# Altium schematic sheet Power_Sheet.SchDoc
size A4; SheetNumber: 4; SheetTotal: 4
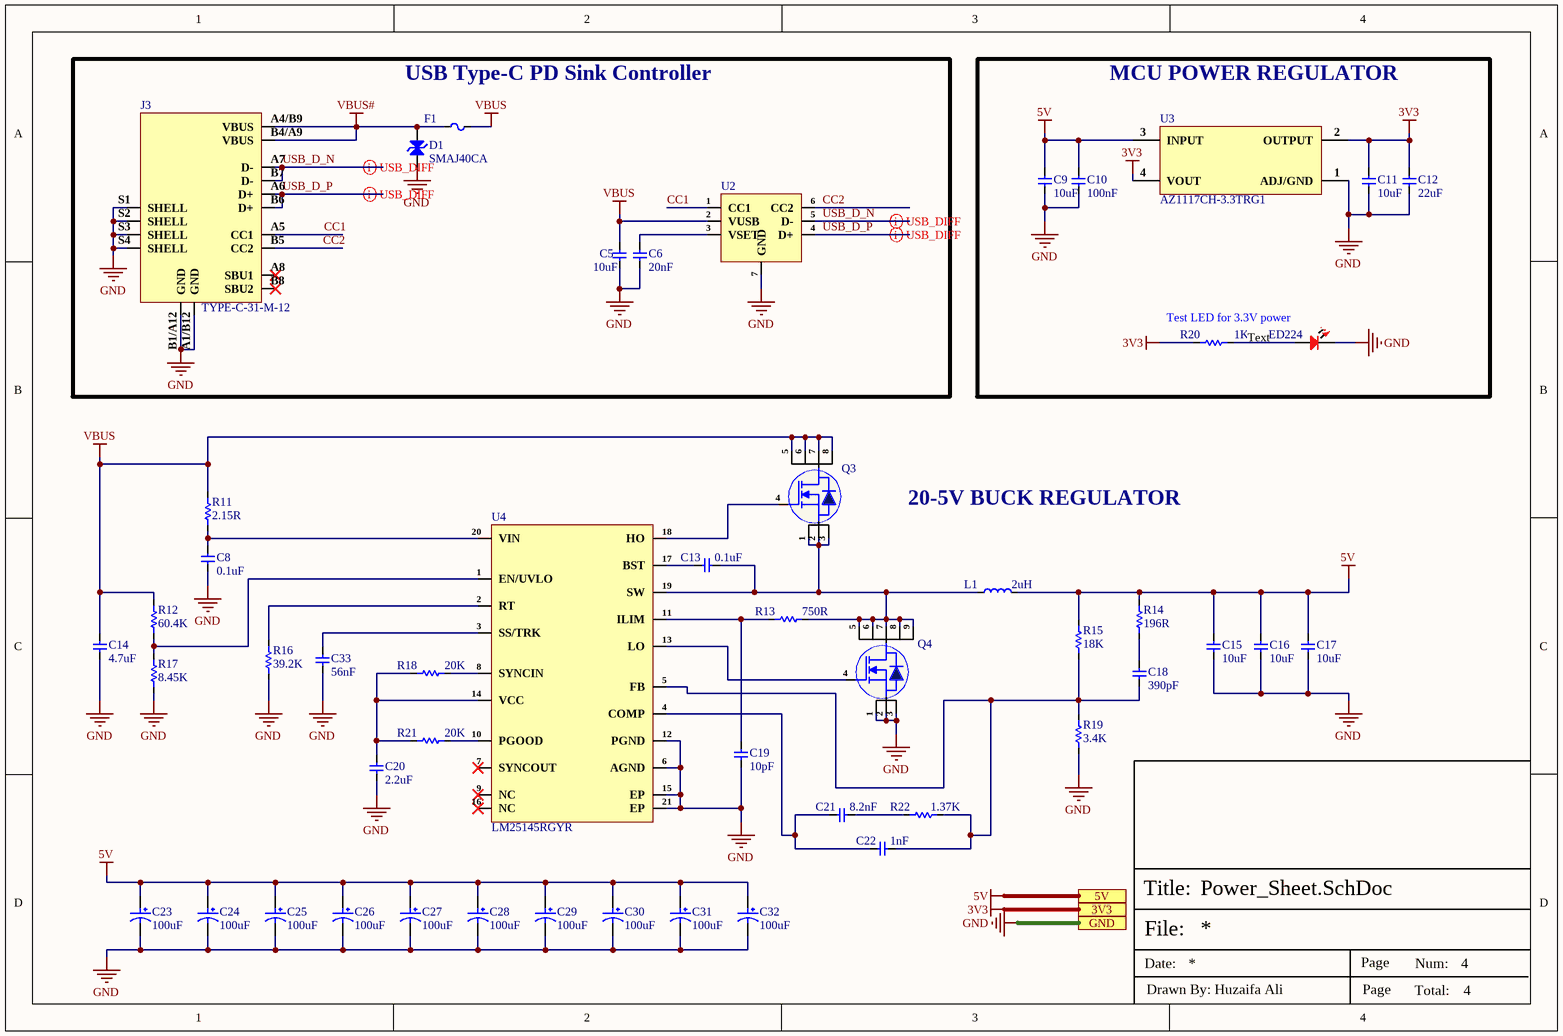
[diagram p0: Power_Sheet.SchDoc]

## Parts
C5  10uF  [Cap-0603]
C6  20nF  [Cap-0603]
C8  0.1uF  [Cap-0603]
C9  10uF  [Cap-0603]
C10  100nF  [Cap-0402]
C11  10uF  [Cap-0603]
C12  22uF  [Cap-0805]
C13  0.1uF  [Cap-0603]
C14  4.7uF  [Cap-0402]
C15  10uF  [Cap-0603]
C16  10uF  [Cap-0603]
C17  10uF  [Cap-0603]
C18  390pF  [Cap-0402]
C19  10pF  [Cap-0603]
C20  2.2uF  [Cap-0402]
C21  8.2nF  [Cap-0402]
C22  1nF  [Cap-0402]
C23  100uF  [EFVM025ADA101M0645]
C24  100uF  [EFVM025ADA101M0645]
C25  100uF  [EFVM025ADA101M0645]
C26  100uF  [EFVM025ADA101M0645]
C27  100uF  [EFVM025ADA101M0645]
C28  100uF  [EFVM025ADA101M0645]
C29  100uF  [EFVM025ADA101M0645]
C30  100uF  [EFVM025ADA101M0645]
C31  100uF  [EFVM025ADA101M0645]
C32  100uF  [EFVM025ADA101M0645]
C33  56nF  [Cap-0402]
D1  SMAJ40CA  [SMA Bi Directional]
F1  CF06V2T3R15  [Fuse-0603]  (value not drawn)
J3  TYPE-C-31-M-12  [TYPE-C-31-M-12_]
L1  2uH  [XAL1580-202MED]
LED224  RED  [LED-0603]  (value not drawn)
Q3  CSD17309Q3  [8-VSON-CLIP (3.3x3.3)]  (value not drawn)
Q4  CSD17573Q5B  [PDFN-8(5x6)]  (value not drawn)
R11  2.15R  [Res-0603]
R12  60.4K  [Res-0402]
R13  750R  [Res-0402]
R14  196R  [Res-0402]
R15  18K  [Res-0402]
R16  39.2K  [Res-0402]
R17  8.45K  [Res-0603]
R18  20K  [Res-0603]
R19  3.4K  [Res-0402]
R20  1K  [Res-0603]
R21  20K  [Res-0603]
R22  1.37K  [Res-0402]
U2  HUSB237-AA001-DN06R  [DFN-6L-EP(2x2)]  (value not drawn)
U3  AZ1117CH-3.3TRG1  [SOT- 223]
U4  LM25145RGYR  [20-VQFN (3.5x4.5)]

## Blocks framed on the sheet
USB Type-C PD Sink Controller: C5 C6 D1 F1 J3 U2
MCU POWER REGULATOR: C9-C12 LED224 R20 U3

## Ports
3V3 (see Top_Sheet[1A], Controller_Sheet[3D]), 5V (see Top_Sheet[1A], Controller_Sheet[3D], LED_Sheet[3D]), GND (see Top_Sheet[2B], Controller_Sheet[3D], LED_Sheet[3D])

## Nets
3V3: C11.2 C12.2 R20.1 U3.2(OUTPUT) U3.4(VOUT) ; port 3V3
5V: C9.2 C10.2 C15.2 C16.2 C17.2 C23.1 C24.1 C25.1 C26.1 C27.1 C28.1 C29.1 C30.1 C31.1 C32.1 L1.2 R14.2 R15.2 U3.3(INPUT) ; port 5V
GND: C5.1 C6.1 C8.1 C9.1 C10.1 C11.1 C12.1 C14.1 C15.1 C16.1 C17.1 C19.1 C20.1 C23.2 C24.2 C25.2 C26.2 C27.2 C28.2 C29.2 C30.2 C31.2 C32.2 C33.1 D1.1(A) J3.A1/B12(GND) J3.B1/A12(GND) J3.S1(SHELL) J3.S2(SHELL) J3.S3(SHELL) J3.S4(SHELL) LED224.2 Q4.1(S) Q4.2(S) Q4.3(S) R16.1 R17.1 R19.1 U2.7(GND) U3.1(ADJ/GND) U4.6(AGND) U4.12(PGND) U4.15(EP) U4.21(EP) ; port GND
VBUS: C5.2 C14.2 F1.2 Q3.5(D) Q3.6(D) Q3.7(D) Q3.8(D) R11.2 R12.2 U2.2(VUSB)
VBUS#: D1.2(K) F1.1 J3.A4/B9(VBUS) J3.B4/A9(VBUS)
CC1: J3.A5(CC1) U2.1(CC1)
CC2: J3.B5(CC2) U2.6(CC2)
USB_D_N: J3.A7(D-) J3.B7(D-) U2.5(D-)
USB_D_P: J3.A6(D+) J3.B6(D+) U2.4(D+)
NetC6_2: C6.2 U2.3(VSET)
NetC8_2: C8.2 R11.1 U4.20(VIN)
NetC13_1: C13.1 U4.17(BST)
NetC13_2: C13.2 L1.1 Q3.1(S) Q3.2(S) Q3.3(S) Q4.5(D) Q4.6(D) Q4.7(D) Q4.8(D) Q4.9(D) R13.2 U4.19(SW)
NetC18_1: C18.1 C22.2 R15.1 R19.2 R22.2 U4.5(FB)
NetC18_2: C18.2 R14.1
NetC19_2: C19.2 R13.1 U4.11(ILIM)
NetC20_2: C20.2 R18.1 R21.1 U4.14(VCC)
NetC21_1: C21.1 C22.1 U4.4(COMP)
NetC21_2: C21.2 R22.1
NetC33_2: C33.2 U4.3(SS/TRK)
NetLED224_1: LED224.1 R20.2
NetQ3_4: Q3.4(G) U4.18(HO)
NetQ4_4: Q4.4(G) U4.13(LO)
NetR12_1: R12.1 R17.2 U4.1(EN/UVLO)
NetR16_2: R16.2 U4.2(RT)
NetR18_2: R18.2 U4.8(SYNCIN)
NetR21_2: R21.2 U4.10(PGOOD)

Not connected (* = marked no-connect by the designer): J3 A8(SBU1)* B8(SBU2)*; U4 7(SYNCOUT)* 9(NC)* 16(NC)*

## Layout directives
differential pair; net class USB_DIFF; differential pair class USB_DIFF_Lines; rule Matched Net Lengths [Tolerance = 20mil]; rule Impedance Constraint [Min = 85.00    Max = 95.00    ]: USB_D_N, USB_D_P

## Notes on the sheet
- Test LED for 3.3V power
- (near R20) Text
- (near LED224) Text
- 20-5V BUCK REGULATOR
- File:
- Title:
- Date:
- Page
- Num:
- Total:
- Drawn By: Huzaifa Ali

## Library data of the parts
C5 C9 C11 = GRM188R61E106KA73D: CAP CER 10UF 25V X5R 0603; Manufacturer: Murata; Supplier 1: Mouser; Manufacturer Part Number: GRM188R61E106KA73D; RoHS: Yes; Category: Ceramic Capacitors; Stock 1: 319428; Pricing 1: 1=0.36000, 10=0.25800, 50=0.25800, 100=0.15500, 1000=0.09800, 10000=0.06900 (USD); Case/Package: 0603; RoHS Compliant: Yes; ComponentLink1URL: https://search.murata.co.jp/Ceramy/image/img/A01X/G101/ENG/GRM188R61E106KA73-01.pdf?src-supplier=Digi-Key; ComponentLink1Description: https://search.murata.co.jp/Ceramy/image/img/A01X/G101/ENG/GRM188R61E106KA73-01.pdf?src-supplier=Digi-Key; Supplier Part Number 1: 81-GRM188R61E106KA3D; LCSC Part Number: C344022
C6 = CGA0603X7R203K500JT: 50V 20nF X7R ±10% 0603 Multilayer Ceramic Capacitors MLCC - SMD/SMT ROHS; Manufacturer: HRE; LCSC Part Number: C36911410; Manufacturer Part Number: CGA0603X7R203K500JT; Value: 20nF; Item Type: Capacitor; ComponentLink1Description: LCSC; ComponentLink1URL: https://www.lcsc.com/product-detail/Multilayer-Ceramic-Capacitors-MLCC-SMD-SMT_HRE-CGA0603X7R203K500JT_C36911410.html
C8 C13 = CC0603JRX7R9BB104: CAP CER 0.1UF 50V X7R 0603; Manufacturer: Yageo; Item Type: Capacitors; Material: 4241ConductorMaterial; Supplier: Future Electronics; LCSC Part Number: C91183; Manufacturer Part Number: CC0603JRX7R9BB104; RoHS: Yes; Stock: 204000; Pricing: 4000=0.0077, 16000=0.0073, 60000=0.007, 160000=0.0068, 400000=0.0064 (USD); Pins: 2NUMBER; Lead Free: 5697LeadFree; Halogen Free: 5694HalogenFree; ComponentLink1URL: https://datasheet.ciiva.com/11465/upy-gphc-x7r-6-3v-to-50v-8-11465038.pdf?src-supplier=Avnet; ComponentLink1Description: https://datasheet.ciiva.com/11465/upy-gphc-x7r-6-3v-to-50v-8-11465038.pdf?src-supplier=Avnet
C10 = CC0402KRX5R7BB104: CAP CER 0.1UF 16V X5R 0402; Manufacturer: Yageo; Tolerance: 10%; Supplier 1: Mouser; Manufacturer Part Number: CC0402KRX5R7BB104; RoHS: Yes; Category: Ceramic Capacitors; Stock 1: 936792; Pricing 1: 1=0.10000, 10=0.02300, 50=0.02300, 100=0.01100, 1000=0.00600, 10000=0.00400 (USD); Mount: Surface Mount; Case/Package: 0402; Number of Pins: 2; Case Code (Metric): 1005; Case Code (Imperial): 0402; Min Operating Temperature: -55°C; Max Operating Temperature: 85°C; Capacitance: 100nF; Dielectric: X5R; Packaging: Tape and Reel; Voltage Rating: 16V; Package Quantity: 1; Voltage Rating (DC): 16V; Termination: SMD/SMT; Resistor Type: Ceramic; Series: CC; Construction: Flat; Length: 1mm; Width: 0.02inch; Height: 0.5mm; Thickness: 0.022inch; Depth: 0.5mm; Radiation Hardening: No; REACH SVHC: Unknown; Lead Free: Lead Free; Halogen Free: Halogen Free; RoHS Compliant: Yes; ComponentLink1URL: https://datasheet.ciiva.com/155/mlccorderingcode-155879.pdf?src-supplier=Digi-Key; ComponentLink1Description: https://datasheet.ciiva.com/155/mlccorderingcode-155879.pdf?src-supplier=Digi-Key; ComponentLink2URL: https://datasheet.ciiva.com/155/mlccorderingcode-155878.pdf?src-supplier=Digi-Key; ComponentLink2Description: https://datasheet.ciiva.com/155/mlccorderingcode-155878.pdf?src-supplier=Digi-Key; ComponentLink3URL: https://datasheet.ciiva.com/155/mlccorderingcode-155880.pdf?src-supplier=Digi-Key; ComponentLink3Description: https://datasheet.ciiva.com/155/mlccorderingcode-155880.pdf?src-supplier=Digi-Key; ComponentLink4URL: https://datasheet.ciiva.com/11464/upy-gphc-x5r-4v-to-50v-12-11464869.pdf?src-supplier=Avnet; ComponentLink4Description: https://datasheet.ciiva.com/11464/upy-gphc-x5r-4v-to-50v-12-11464869.pdf?src-supplier=Avnet; Supplier Part Number 1: 603-CC402KRX5R7BB104; LCSC Part Number: C106204
C12 = C2012X5R1V226MT000E: CAP CER 22UF 35V X5R 0805; Manufacturer: TDK Corporation; Item Type: Capacitor; Manufacturer Part Number: C2012X5R1V226MT000E; Package: 0805; ComponentLink1Description: LCSC; ComponentLink1URL: https://www.lcsc.com/product-detail/Multilayer-Ceramic-Capacitors-MLCC-SMD-SMT_TDK-C2012X5R1V226M125AC_C2179409.html; LCSC Part Number: C338080
C14 = CC1206KKX7R9BB475: CAP CER 4.7UF 50V X7R 1206; Manufacturer: Yageo; Item Type: Capacitors; Material: Ceramic; Tolerance: 10%; Supplier: Digikey; LCSC Part Number: C132170; Manufacturer Part Number: CC1206KKX7R9BB475; RoHS: Yes; Stock: 6022; Pricing: 1=0.42, 10=0.255, 100=0.1694, 1000=0.1248 (USD); Mounting Technology: Surface Mount; Case/Package: 1206; Case Code (Metric): 3216; Case Code (Imperial): 1206; Min Operating Temperature: -55°C; Max Operating Temperature: 125°C; Value: 4.7uF; Packaging: Cut Tape; Voltage Rating: 50V; Series: CC; Length: 0.126inch; Width: 0.063inch; Height: 1.45mm; Thickness: 0.071inch; Lead Free: Lead Free; Halogen Free: Halogen Free; RoHS Compliant: Yes; ComponentLink1URL: http://www.mouser.com/ds/2/447/Yageo_UPY-GP_NP0_16V-to-50V_9-358835.pdf?src-supplier=Mouser; ComponentLink1Description: http://www.mouser.com/ds/2/447/Yageo_UPY-GP_NP0_16V-to-50V_9-358835.pdf?src-supplier=Mouser; ComponentLink2URL: https://datasheet.octopart.com/CC1206KKX7R9BB475-Yageo-datasheet-147453679.pdf?src-supplier=Newark; ComponentLink2Description: https://datasheet.octopart.com/CC1206KKX7R9BB475-Yageo-datasheet-147453679.pdf?src-supplier=Newark; ComponentLink3URL: http://www.yageo.com/documents/recent/UPY-GPHC_X7R_6.3V-to-50V_18.pdf?src-supplier=Digikey; ComponentLink3Description: http://www.yageo.com/documents/recent/UPY-GPHC_X7R_6.3V-to-50V_18.pdf?src-supplier=Digikey; ComponentLink4URL: https://datasheet.octopart.com/CC1206KKX7R9BB475-Yageo-datasheet-166511530.pdf?src-supplier=Future+Electronics; ComponentLink4Description: https://datasheet.octopart.com/CC1206KKX7R9BB475-Yageo-datasheet-166511530.pdf?src-supplier=Future+Electronics
C15-C17 = GRM188Z71A106KA73D: CAP CER 10UF 10V X7R 0603; Manufacturer: Murata; Item Type: Capacitor; Material: 4241ConductorMaterial; Tolerance: 10%; Supplier: Mouser; LCSC Part Number: C2959727; Manufacturer Part Number: GRM188Z71A106KA73D; RoHS: Yes; Stock: 390983; Pricing: 1=0.36, 10=0.155, 50=0.155, 100=0.104, 1000=0.094, 10000=0.065 (USD); Case/Package: 345Case; Min Operating Temperature: -55°C; Max Operating Temperature: 125°C; Value: 10uF; Voltage Rating: 10V; Length: 1.6mm; Width: 800um; Height: 1mm; Thickness: 800um; RoHS Compliant: Yes; ComponentLink1URL: https://datasheet.octopart.com/GRM188Z71A106KA73D-Murata-datasheet-165579666.pdf?src-supplier=TME; ComponentLink1Description: https://datasheet.octopart.com/GRM188Z71A106KA73D-Murata-datasheet-165579666.pdf?src-supplier=TME
C18 = CC0402JRX7R9BB391: CAP CER 390PF 50V X7R 0402; Manufacturer: Yageo; Item Type: Capacitors; Tolerance: 5%; Supplier: Digikey; LCSC Part Number: C527008; Manufacturer Part Number: CC0402JRX7R9BB391; RoHS: Yes; Stock: 114168; Pricing: 1=0.1, 10=0.031, 100=0.0179, 1000=0.01116, 2500=0.0095, 5000=0.00851 (USD); Mounting Technology: Surface Mount; Case/Package: 0402; Case Code (Imperial): 0402; Case Code (Metric): 1005; Weight: 2.3E-05oz; Min Operating Temperature: -55°C; Max Operating Temperature: 125°C; Packaging: Tape and Reel; Value: 390pF; Voltage Rating (DC): 50V; Dielectric: X7R; Termination: SMD/SMT; Voltage Rating: 50V; Series: CC; Length: 0.039inch; Width: 0.02inch; Thickness: 0.022inch; Lead Free: Lead Free; Halogen Free: Halogen Free; RoHS Compliant: Yes; ComponentLink1URL: http://www.mouser.com/ds/2/447/Yageo_UPY-GP_NP0_16V-to-50V_9-358835.pdf?src-supplier=Mouser; ComponentLink1Description: http://www.mouser.com/ds/2/447/Yageo_UPY-GP_NP0_16V-to-50V_9-358835.pdf?src-supplier=Mouser; ComponentLink2URL: http://www.yageo.com/documents/recent/UPY-GPHC_X7R_6.3V-to-50V_18.pdf?src-supplier=Digikey; ComponentLink2Description: http://www.yageo.com/documents/recent/UPY-GPHC_X7R_6.3V-to-50V_18.pdf?src-supplier=Digikey; ComponentLink3URL: http://www.yageo.com/exep/pages/download/literatures/ProductSelectionGuide%202014_Final_2.pdf?src-supplier=Digikey; ComponentLink3Description: http://www.yageo.com/exep/pages/download/literatures/ProductSelectionGuide%202014_Final_2.pdf?src-supplier=Digikey
C19 = CC0603FRNPO0BN100: CAP CER 10PF 100V C0G/NPO 0603; Manufacturer: Yageo; Item Type: Capacitors; Tolerance: 1%; Supplier: Digikey; LCSC Part Number: C576764; Manufacturer Part Number: CC0603FRNPO0BN100; RoHS: Yes; Stock: 41006; Pricing: 1=0.16, 10=0.09, 100=0.0555, 1000=0.03766 (USD); Mounting Technology: Surface Mount; Case/Package: 0603; Min Operating Temperature: -55°C; Max Operating Temperature: 125°C; Packaging: Tape and Reel; Value: 10pF; Voltage Rating: 100V; Series: CC; Length: 0.063inch; Width: 0.031inch; Thickness: 0.035inch; RoHS Compliant: Yes; ComponentLink1URL: https://media.digikey.com/pdf/Data%20Sheets/Yageo%20PDFs/CCseries_mlcc_2002.pdf?src-supplier=Digikey; ComponentLink1Description: https://media.digikey.com/pdf/Data%20Sheets/Yageo%20PDFs/CCseries_mlcc_2002.pdf?src-supplier=Digikey; ComponentLink2URL: http://www.yageo.com/exep/pages/download/literatures/ProductSelectionGuide%202014_Final_2.pdf?src-supplier=Digikey; ComponentLink2Description: http://www.yageo.com/exep/pages/download/literatures/ProductSelectionGuide%202014_Final_2.pdf?src-supplier=Digikey
C20 = C1005X5R1V225K050BC: CAP CER 2.2UF 35V X5R 0402; Manufacturer: TDK; Item Type: Capacitors; Dielectric Material: Ceramic; Material: 4241ConductorMaterial; Tolerance: 10%; Supplier: Digikey; Supplier Part Number: 445-9028-1-ND; Manufacturer Part Number: C1005X5R1V225K050BC; RoHS: Yes; Stock: 1458755; Pricing: 1=0.21, 10=0.123, 50=0.0866, 100=0.0754, 500=0.05646, 1000=0.05055, 2500=0.04429, 5000=0.04049 (USD); Mounting Technology: Surface Mount; Case/Package: 0402; Case Code (Imperial): 0402; Case Code (Metric): 1005; Weight: 2.3E-05oz; Min Operating Temperature: -55°C; Max Operating Temperature: 85°C; Packaging: Tape and Reel; Voltage Rating: 35V; Value: 2.2uF; Voltage Rating (DC): 35V; Package Quantity: 1; Dielectric: X5R; Termination: SMD/SMT; Series: C; Length: 1mm; Width: 0.02inch; Height: 0.5mm; Thickness: 0.022inch; Depth: 0.5mm; Lead Free: Lead Free; RoHS Compliant: Yes; Reach SVHC Compliant: Unknown; ComponentLink1URL: https://datasheet.ciiva.com/24218/mlcc-commercial-general-en-24218938.pdf?src-supplier=Mouser; ComponentLink1Description: https://datasheet.ciiva.com/24218/mlcc-commercial-general-en-24218938.pdf?src-supplier=Mouser
C21 = CC0402JRX7R7BB822: CAP CER 8200PF 16V X7R 0402; Manufacturer: Yageo; Item Type: Capacitors; Tolerance: 5%; Supplier: Digikey; LCSC Part Number: C541449; Manufacturer Part Number: CC0402JRX7R7BB822; RoHS: Yes; Stock: 11755; Pricing: 1=0.1, 10=0.032, 100=0.0186, 1000=0.01163, 2500=0.00988, 5000=0.00889 (USD); Mounting Technology: Surface Mount; Case/Package: 0402; Min Operating Temperature: -55°C; Max Operating Temperature: 125°C; Packaging: Tape and Reel; Value: 8.2nF; Voltage Rating: 16V; Voltage Rating (DC): 16V; Dielectric: X7R; Series: CC; Length: 0.039inch; Width: 0.02inch; Thickness: 0.022inch; Lead Free: Lead Free; Halogen Free: Halogen Free; RoHS Compliant: Yes; ComponentLink1URL: https://www.mouser.com/ds/2/447/Yageo_UPY-GP_NP0_16V-to-50V_9-1211922.pdf?src-supplier=Mouser; ComponentLink1Description: https://www.mouser.com/ds/2/447/Yageo_UPY-GP_NP0_16V-to-50V_9-1211922.pdf?src-supplier=Mouser; ComponentLink2URL: http://www.yageo.com/exep/pages/download/literatures/ProductSelectionGuide%202014_Final_2.pdf?src-supplier=Digikey; ComponentLink2Description: http://www.yageo.com/exep/pages/download/literatures/ProductSelectionGuide%202014_Final_2.pdf?src-supplier=Digikey
C22 = CC0402JRNPO7BN102: CAP CER 1000PF 16V C0G/NPO 0402; Manufacturer: Yageo; Item Type: Capacitors; Supplier: Digikey; LCSC Part Number: C7227683; Manufacturer Part Number: CC0402JRNPO7BN102; RoHS: Yes; Stock: 32647; Pricing: 1=0.11, 10=0.059, 100=0.0353, 1000=0.02317, 2500=0.02016, 5000=0.01835 (USD); RoHS Compliant: Yes
C23-C32 = EFVM025ADA101M0645: 100uF 25V ±20% SMD,D6.3xL4.5mm Aluminum Electrolytic Capacitors - SMD ROHS; Manufacturer: FOLLON; Manufacturer Part Number: EFVM025ADA101M0645; Package: SMD,D6.3xL4.5mm; LCSC Part Number: C33129633; Item Type: Capacitor; ComponentLink1Description: LCSC; ComponentLink1URL: https://lcsc.com/product-detail/Aluminum-Electrolytic-Capacitors-SMD_FOLLON-EFVM025ADA101M0645_C33129633.html
C33 = CC0402JRX7R7BB563: CAP CER 0.056UF 16V X7R 0402; Manufacturer: Yageo; Item Type: Capacitors; Dielectric: 1511DielectricType; Supplier: Digikey; LCSC Part Number: C576711; Manufacturer Part Number: CC0402JRX7R7BB563; RoHS: No; Stock: 16798; Pricing: 1=0.1, 10=0.042, 100=0.0244, 1000=0.01556, 2500=0.01338, 5000=0.01207 (USD); Case/Package: 343Case; Value: 56nF; Voltage Rating (DC): 16V; Halogen Free: 5694HalogenFree; Lead Free: 5697LeadFree
D1 = SMAJ40CA: 64.5V 44.4V 40V SMA(DO-214AC) TVS ROHS; Manufacturer: MDD; Item Type: TVS Diode; Manufacturer Part Number: SMAJ40CA; Package: SMA(DO-214AC); LCSC Part Number: C113970; ComponentLink1Description: LCSC; ComponentLink1URL: https://www.lcsc.com/product-detail/TVS_MDD-Microdiode-Electronics-SMAJ40CA_C113970.html
F1 = CF06V2T3R15: 50A SMD Fuse 3.15A 24V 0603 Disposable fuses ROHS; Manufacturer: TA-I Tech; Manufacturer Part Number: CF06V2T3R15; Package: 0603; LCSC Part Number: C163108; Item Type: Fuses; ComponentLink1Description: LCSC; ComponentLink1URL: https://www.lcsc.com/product-detail/Disposable-fuses_TA-I-Tech-CF06V2T3R15_C163108.html
J3 = TYPE-C-31-M-12: 5A 1 16P Female Type-C SMD USB Connectors ROHS; Manufacturer: Korean Hroparts Elec; ComponentLink1Description: LCSC; ComponentLink1URL: https://www.lcsc.com/product-detail/USB-Connectors_Korean-Hroparts-Elec-TYPE-C-31-M-12_C165948.html; Manufacturer Part Number: TYPE-C-31-M-12; Footprint: Custom; LCSC Part Number: C165948; Item Type: USB Connector
L1 = XAL1580-202MED: POWER INDUCTOR, SHIELDED, 20% TO; Manufacturer: Coilcraft; Item Type: Fixed Inductors; Core Material: Composite; Self Resonant Frequency: 20.1MHz; Max DC Current: 39.9A; Test Frequency: 100kHz; Supplier: Mouser; LCSC Part Number: C3911594; Manufacturer Part Number: XAL1580-202MED; RoHS: Yes; Stock: 555; Pricing: 1=8.76, 10=8.76, 50=8.76, 100=8.76, 1000=6.66, 10000=6.66 (USD); Min Operating Temperature: -40°C; Max Operating Temperature: 90°C; Packaging: Tape and Reel; Tolerance: 20%; Shielding: Shielded; Value: 2uH; Termination: SMD/SMT; Series: XAL1580; Length: 16.4mm; Width: 15.4mm; Height: 7.7mm; Lead Free: Contains Lead; RoHS Compliant: Yes; ComponentLink1URL: http://www.mouser.com/ds/2/597/xal1580-270689.pdf?src-supplier=Mouser; ComponentLink1Description: http://www.mouser.com/ds/2/597/xal1580-270689.pdf?src-supplier=Mouser
LED224 = NCD0603R3: RED LED 0603 Light Emitting Diodes; Manufacturer: Foshan NationStar Optoelectronics; Manufacturer Part Number: NCD0603R3; Package: 0603; Item Type: LED; LCSC Part Number: C3151730; ComponentLink1Description: LCSC; ComponentLink1URL: https://www.lcsc.com/product-detail/Light-Emitting-Diodes-LED_Foshan-NationStar-Optoelectronics-NCD0603R3_C3151730.html
Q3 = CSD17309Q3: MOSFET N-CH 30V 20A/60A 8VSON; Manufacturer: Texas Instruments; Supplier: Mouser; Supplier Part Number: 595-CSD17309Q3; Manufacturer Part Number: CSD17309Q3; RoHS: Yes; Category: MOSFETs; Stock: 6648; Pricing: 1=0.95, 10=0.824, 50=0.824, 100=0.661, 1000=0.48, 10000=0.411 (USD); ComponentLink1URL: https://datasheet.ciiva.com/6381/csd17309q3-6381394.pdf?src-supplier=Digikey; ComponentLink1Description: https://datasheet.ciiva.com/6381/csd17309q3-6381394.pdf?src-supplier=Digikey; ComponentLink2URL: https://datasheet.ciiva.com/4438/slps261a-122188-4438334.pdf?src-supplier=Mouser; ComponentLink2Description: https://datasheet.ciiva.com/4438/slps261a-122188-4438334.pdf?src-supplier=Mouser; ComponentLink3URL: https://datasheet.ciiva.com/1255/csd17309q3-1255355.pdf?src-supplier=Newark; ComponentLink3Description: https://datasheet.ciiva.com/1255/csd17309q3-1255355.pdf?src-supplier=Newark; ComponentLink4URL: https://datasheet.ciiva.com/7968/1276211-7968248.pdf?src-supplier=Element14; ComponentLink4Description: https://datasheet.ciiva.com/7968/1276211-7968248.pdf?src-supplier=Element14; ComponentLink5URL: https://datasheet.ciiva.com/6381/csd17309q3-6381350.pdf?src-supplier=Digikey; ComponentLink5Description: https://datasheet.ciiva.com/6381/csd17309q3-6381350.pdf?src-supplier=Digikey; LCSC Part Number: C485528; Item Type: Mosfet
Q4 = CSD17573Q5B: MOSFET N-CH 30V 100A 8VSON; Manufacturer: Texas Instruments; Item Type: MOSFETs; Number of Channels: 1NUMBER; Power Dissipation: 3.2W; Supplier: Mouser; LCSC Part Number: C202231; Manufacturer Part Number: CSD17573Q5B; RoHS: Yes; Stock: 570; Pricing: 1=1.9, 10=1.33, 50=1.33, 100=0.946, 1000=0.722, 10000=0.595 (USD); Drain to Source Breakdown Voltage: 30V; Length: 5mm; Width: 5mm; Thickness: 950um; Lead Free: 5698LeadFree; ComponentLink1URL: http://www.ti.com/general/docs/lit/getliterature.tsp?genericPartNumber=CSD17573Q5B&&fileType=pdf&src-supplier=Avnet; ComponentLink1Description: http://www.ti.com/general/docs/lit/getliterature.tsp?genericPartNumber=CSD17573Q5B&&fileType=pdf&src-supplier=Avnet; ComponentLink2URL: http://www.ti.com/general/docs/suppproductinfo.tsp?distId=10&amp;gotoUrl=http%3A%2F%2Fwww.ti.com%2Flit%2Fgpn%2Fcsd17573q5b&src-supplier=Digikey; ComponentLink2Description: http://www.ti.com/general/docs/suppproductinfo.tsp?distId=10&amp;gotoUrl=http%3A%2F%2Fwww.ti.com%2Flit%2Fgpn%2Fcsd17573q5b&src-supplier=Digikey; ComponentLink3URL: http://www.ti.com/lit/ds/symlink/csd17573q5b.pdf?src-supplier=Digikey; ComponentLink3Description: http://www.ti.com/lit/ds/symlink/csd17573q5b.pdf?src-supplier=Digikey; ComponentLink4URL: http://www.ti.com/lit/gpn/csd17573q5b?src-supplier=Mouser; ComponentLink4Description: http://www.ti.com/lit/gpn/csd17573q5b?src-supplier=Mouser
R11 = RC0603FR-072R15L: RES 2.15 OHM 1% 1/10W 0603; Manufacturer: Yageo; Item Type: Resistor; Supplier: Digikey; LCSC Part Number: C482784; Manufacturer Part Number: RC0603FR-072R15L; RoHS: Yes; Stock: 1242; Pricing: 1=0.1, 10=0.016, 100=0.0133, 1000=0.01122 (USD); ComponentLink1URL: https://datasheet.ciiva.com/2456/pyu-r-int-thick-7-2456930.pdf?src-supplier=Digikey; ComponentLink1Description: https://datasheet.ciiva.com/2456/pyu-r-int-thick-7-2456930.pdf?src-supplier=Digikey; ComponentLink2URL: https://datasheet.ciiva.com/2456/pyu-r-int-thick-7-2456931.pdf?src-supplier=Digikey; ComponentLink2Description: https://datasheet.ciiva.com/2456/pyu-r-int-thick-7-2456931.pdf?src-supplier=Digikey; ComponentLink3URL: https://datasheet.ciiva.com/12562/rc0603-272842-12562024.pdf?src-supplier=Mouser; ComponentLink3Description: https://datasheet.ciiva.com/12562/rc0603-272842-12562024.pdf?src-supplier=Mouser; ComponentLink4URL: https://datasheet.ciiva.com/2456/pyu-r-int-thick-7-2456932.pdf?src-supplier=Digikey; ComponentLink4Description: https://datasheet.ciiva.com/2456/pyu-r-int-thick-7-2456932.pdf?src-supplier=Digikey
R12 = RT0402BRD0760K4L: RES SMD 60.4KOHM 0.1% 1/16W 0402; Manufacturer: Yageo; Item Type: Resistors; Value: 60.4kR; Power Rating: 62.5mW; Voltage Rating: 50V; Max Power Dissipation: 63mW; Temperature Coefficient: 25ppm/°C; Supplier: Digikey; LCSC Part Number: C852866; Manufacturer Part Number: RT0402BRD0760K4L; RoHS: Yes; Stock: 33557; Pricing: 1=0.16, 10=0.124, 50=0.1, 100=0.0898, 500=0.06834, 1000=0.06018, 5000=0.04449 (USD); Case/Package: 0402; Case Code (Metric): 1005; Case Code (Imperial): 0402; Weight: 2.3E-05oz; Min Operating Temperature: -55°C; Max Operating Temperature: 155°C; Package Quantity: 10000; Packaging: Tape and Reel; Tolerance: 0.1%; Number of Terminations: 2; Termination: SMD/SMT; Voltage Rating (DC): 50V; Features: Moisture Resistant; Series: RT; Length: 0.039inch; Width: 0.5mm; Height: 0.014inch; Lead Free: Lead Free; RoHS Compliant: Yes; ComponentLink1URL: https://datasheet.ciiva.com/2582/pyu-rt-1-to-0-05-rohs-l-4-2582449.pdf?src-supplier=Digikey; ComponentLink1Description: https://datasheet.ciiva.com/2582/pyu-rt-1-to-0-05-rohs-l-4-2582449.pdf?src-supplier=Digikey; ComponentLink2URL: https://datasheet.ciiva.com/46635/pyu-rt-1-to-0-05-rohs-l-5-46635208.pdf?src-supplier=Digikey; ComponentLink2Description: https://datasheet.ciiva.com/46635/pyu-rt-1-to-0-05-rohs-l-5-46635208.pdf?src-supplier=Digikey; ComponentLink3URL: https://datasheet.ciiva.com/12796/pyu-rt-1-to-0-05-rohs-l-4-12796729.pdf?src-supplier=Mouser; ComponentLink3Description: https://datasheet.ciiva.com/12796/pyu-rt-1-to-0-05-rohs-l-4-12796729.pdf?src-supplier=Mouser
R13 = RT0402FRE07750RL: RES SMD 750 OHM 1% 1/16W 0402; Manufacturer: Yageo; Item Type: Resistors; Max Power Dissipation: 63mW; Temperature Coefficient: 50ppm/°C; Voltage Rating (DC): 50V; Supplier: Digikey; LCSC Part Number: C854422; Manufacturer Part Number: RT0402FRE07750RL; RoHS: Yes; Stock: 46842; Pricing: 1=0.1, 10=0.018, 50=0.0174, 100=0.0163, 500=0.0158, 1000=0.0153, 5000=0.01224 (USD); Case/Package: 0402; Contact Plating: Tin,Matte; Min Operating Temperature: -55°C; Max Operating Temperature: 125°C; Value: 750R; Tolerance: 1%; Package Quantity: 10000; Packaging: Tape and Reel; Number of Terminations: 2; Series: RT; Voltage Rating: 50V; Length: 0.039inch; Width: 0.02inch; Height: 0.014inch; Lead Free: Lead Free; RoHS Compliant: Yes; ComponentLink1URL: https://datasheet.ciiva.com/2561/pyu-rt-1-to-0-05-rohs-l-5-2561844.pdf?src-supplier=Digikey; ComponentLink1Description: https://datasheet.ciiva.com/2561/pyu-rt-1-to-0-05-rohs-l-5-2561844.pdf?src-supplier=Digikey
R14 = RC0402FR-07196RL: RES 196 OHM 1% 1/16W 0402; Manufacturer: Yageo; Item Type: Resistors; Voltage Rating (DC): 50V; Supplier: Digikey; LCSC Part Number: C477632; Manufacturer Part Number: RC0402FR-07196RL; RoHS: Yes; Stock: 42946; Pricing: 1=0.1, 10=0.007, 100=0.0061, 1000=0.00408, 2500=0.00328 (USD); Lead Free: 5697LeadFree; ComponentLink1URL: https://datasheet.ciiva.com/16743/pyu-rc0402-51-rohs-l-6-r-16743909.pdf?src-supplier=Future+Electronics; ComponentLink1Description: https://datasheet.ciiva.com/16743/pyu-rc0402-51-rohs-l-6-r-16743909.pdf?src-supplier=Future+Electronics
R15 = RT0402BRD0718KL: RES SMD 18K OHM 0.1% 1/16W 0402; Manufacturer: Yageo; Value: 18kR; Power Rating: 62.5mW; Voltage Rating: 50V; Max Power Dissipation: 63mW; Temperature Coefficient: 25ppm/°C; Item Type: Resistor; Supplier: Future Electronics; Supplier Part Number: 4031418; Manufacturer Part Number: RT0402BRD0718KL; RoHS: Yes; Category: Chip SMD Resistors; Stock: 120000; Pricing: 10000=0.02, 20000=0.0196, 40000=0.0191, 50000=0.019, 150000=0.0181 (USD); Case/Package: 0402; Case Code (Metric): 1005; Case Code (Imperial): 0402; Weight: 2.3E-05oz; Min Operating Temperature: -55°C; Max Operating Temperature: 155°C; Package Quantity: 10000; Packaging: Tape and Reel; Tolerance: 0.1%; Number of Terminations: 2; Termination: SMD/SMT; Voltage Rating (DC): 50V; Series: RT; Length: 0.039inch; Width: 0.5mm; Height: 0.014inch; Lead Free: Lead Free; RoHS Compliant: Yes; ComponentLink1URL: https://datasheet.ciiva.com/12798/pyu-rt-1-to-0-05-rohs-l-4-12798951.pdf?src-supplier=Mouser; ComponentLink1Description: https://datasheet.ciiva.com/12798/pyu-rt-1-to-0-05-rohs-l-4-12798951.pdf?src-supplier=Mouser; ComponentLink2URL: https://datasheet.ciiva.com/2582/pyu-rt-1-to-0-05-rohs-l-5-2582178.pdf?src-supplier=Digi-Key; ComponentLink2Description: https://datasheet.ciiva.com/2582/pyu-rt-1-to-0-05-rohs-l-5-2582178.pdf?src-supplier=Digi-Key; LCSC Part Number: C852579
R16 = RT0402BRD0739K2L: RES SMD 39.2KOHM 0.1% 1/16W 0402; Manufacturer: Yageo; Item Type: Resistors; Supplier: Digikey; LCSC Part Number: C723512; Manufacturer Part Number: RT0402BRD0739K2L; RoHS: Yes; Stock: 17375; Pricing: 1=0.16, 10=0.124, 50=0.1, 100=0.0898, 500=0.06834, 1000=0.06018, 5000=0.04449 (USD); ComponentLink1URL: https://datasheet.ciiva.com/12721/pyu-rt-1-to-0-05-rohs-l-4-12721702.pdf?src-supplier=Mouser; ComponentLink1Description: https://datasheet.ciiva.com/12721/pyu-rt-1-to-0-05-rohs-l-4-12721702.pdf?src-supplier=Mouser
R17 = RT0603BRD078K45L: RES SMD 8.45KOHM 0.1% 1/10W 0603; Manufacturer: Yageo; Item Type: Resistor; Voltage Rating: 75V; Value: 8.45kR; Power Rating: 100mW; Temperature Coefficient: 25ppm/°C; Voltage Rating (DC): 50V; Supplier: Digikey; Supplier Part Number: 13-RT0603BRD078K45LCT-ND; Manufacturer Part Number: RT0603BRD078K45L; RoHS: Yes; Stock: 14147; Pricing: 1=0.14, 10=0.104, 50=0.0822, 100=0.0737, 500=0.05612, 1000=0.04959 (USD); Case/Package: 0603; Case Code (Metric): 1608; Case Code (Imperial): 0603; Min Operating Temperature: -55°C; Max Operating Temperature: 155°C; Tolerance: 0.1%; Packaging: Tape and Reel; Termination: SMD/SMT; Series: RT; Max Power Dissipation: 100mW; Number of Terminations: 2; Width: 800um; Lead Free: Lead Free; RoHS Compliant: Yes; ComponentLink1URL: https://datasheet.ciiva.com/12705/pyu-rt-1-to-0-05-rohs-l-4-12705898.pdf?src-supplier=Mouser; ComponentLink1Description: https://datasheet.ciiva.com/12705/pyu-rt-1-to-0-05-rohs-l-4-12705898.pdf?src-supplier=Mouser; LCSC Part Number: C861590
R18 R21 = RC0603FR-0720KL: RES 20K OHM 1% 1/10W 0603; Manufacturer: Yageo; Resistance: 20kR; Temperature Coefficient: 100ppm/°C; Voltage Rating (DC): 50V; Power Rating: 100mW; Item Type: Resistor; Supplier 1: Arrow Electronics; Manufacturer Part Number: RC0603FR-0720KL; RoHS: Yes; Category: Chip SMD Resistors; Stock 1: 945000; Pricing 1: 5000=0.00240, 10000=0.00220, 25000=0.00200, 50000=0.00190, 125000=0.00180 (USD); Case/Package: 0603; Number of Pins: 2; Case Code (Imperial): 0603; Case Code (Metric): 1608; Size Code: 0603; Min Operating Temperature: -55°C; Max Operating Temperature: 155°C; Tolerance: 1%; Packaging: Tape and Reel; Resistor Type: Thick Film; Voltage Rating: 50V; Package Quantity: 1; Termination: SMD/SMT; Number of Terminations: 2; Max Power Dissipation: 100mW; Features: Moisture Resistant; Series: RC; Technology: THICK FILM; Construction: Rectangular; Resistance Tolerance: 1%; Length: 0.063inch; Width: 0.031inch; Height: 0.022inch; Depth: 0.8mm; Lead Free: Lead Free; RoHS Compliant: Yes; REACH SVHC: No SVHC; Military Standard: Not; ComponentLink1URL: https://datasheet.ciiva.com/11808/0900766b80f96399-11808275.pdf?src-supplier=RSComponents; ComponentLink1Description: https://datasheet.ciiva.com/11808/0900766b80f96399-11808275.pdf?src-supplier=RSComponents; ComponentLink2URL: https://datasheet.ciiva.com/22747/443971-22747525.pdf?src-supplier=Element14; ComponentLink2Description: https://datasheet.ciiva.com/22747/443971-22747525.pdf?src-supplier=Element14; ComponentLink3URL: https://datasheet.ciiva.com/2453/pyu-r-int-thick-7-2453911.pdf?src-supplier=Digi-Key; ComponentLink3Description: https://datasheet.ciiva.com/2453/pyu-r-int-thick-7-2453911.pdf?src-supplier=Digi-Key; ComponentLink4URL: https://datasheet.ciiva.com/2453/pyu-r-int-thick-7-2453912.pdf?src-supplier=Digi-Key; ComponentLink4Description: https://datasheet.ciiva.com/2453/pyu-r-int-thick-7-2453912.pdf?src-supplier=Digi-Key; ComponentLink5URL: https://datasheet.ciiva.com/2453/pyu-r-int-thick-7-2453910.pdf?src-supplier=Digi-Key; ComponentLink5Description: https://datasheet.ciiva.com/2453/pyu-r-int-thick-7-2453910.pdf?src-supplier=Digi-Key; Supplier Part Number 1: RC0603FR-0720KL; LCSC Part Number: C105575
R19 = RT0402BRD073K4L: RES SMD 3.4K OHM 0.1% 1/16W 0402; Manufacturer: Yageo; Item Type: Resistors; Voltage Rating: 50V; Value: 3.4kR; Power Rating: 62.5mW; Temperature Coefficient: 25ppm/°C; Max Power Dissipation: 63mW; Supplier: Digikey; LCSC Part Number: C852765; Manufacturer Part Number: RT0402BRD073K4L; RoHS: Yes; Stock: 6058; Pricing: 1=0.1, 10=0.074, 50=0.0652, 100=0.0615, 500=0.05402, 1000=0.0512, 5000=0.04567 (USD); Case/Package: 0402; Case Code (Metric): 1005; Case Code (Imperial): 0402; Min Operating Temperature: -55°C; Max Operating Temperature: 155°C; Tolerance: 0.1%; Packaging: Tape and Reel; Termination: SMD/SMT; Voltage Rating (DC): 50V; Series: RT; Number of Terminations: 2; Length: 1mm; Width: 500um; Height: 350um; Lead Free: Lead Free; RoHS Compliant: Yes; ComponentLink1URL: https://datasheet.ciiva.com/12704/pyu-rt-1-to-0-05-rohs-l-4-12704201.pdf?src-supplier=Mouser; ComponentLink1Description: https://datasheet.ciiva.com/12704/pyu-rt-1-to-0-05-rohs-l-4-12704201.pdf?src-supplier=Mouser
R20 = RC0603FR-071KL: RES SMD 1K OHM 1% 1/10W 0603; Manufacturer: Yageo; Resistance: 1kR; Temperature Coefficient: 100ppm/°C; Power Rating: 100mW; Voltage Rating: 50V; Item type: Resistor; ComponentLink1URL: https://www.verical.com/server-webapp/html/getDatasheet?partID=409289&src-supplier=Verical; ComponentLink1Description: https://www.verical.com/server-webapp/html/getDatasheet?partID=409289&src-supplier=Verical; Supplier 1: Digi-Key; Manufacturer Part Number: RC0603FR-071KL; Stock 1: 21472395; Pricing 1: 1=0.1, 10=0.023, 100=0.0094, 1000=0.0042, 2500=0.0037 (USD); Case/Package: 0603; Contact Plating: Tin,Matte; Case Code (Imperial): 0603; Case Code (Metric): 1608; Min Operating Temperature: -55°C; Max Operating Temperature: 155°C; Tolerance: 1%; Composition: Thick Film; Packaging: Tape and Reel; Termination: SMD/SMT; Military Standard: Not; Length: 1.6mm; Height: 0.45mm; Depth: 0.8mm; Radiation Hardening: No; REACH SVHC: No SVHC; Lead Free: Lead Free; ComponentLink2URL: http://documents.rs-components.com/techlib://itc_doclist_GB.htm?stockno=5048928&src-supplier=RSComponents; ComponentLink2Description: http://documents.rs-components.com/techlib://itc_doclist_GB.htm?stockno=5048928&src-supplier=RSComponents; ComponentLink3URL: http://www.yageo.com/documents/recent/PYu-RC0603_51_RoHS_L_4.pdf?src-supplier=Avnet+Europe; ComponentLink3Description: http://www.yageo.com/documents/recent/PYu-RC0603_51_RoHS_L_4.pdf?src-supplier=Avnet+Europe; ComponentLink4URL: http://www.farnell.com/datasheets/2167052.pdf?src-supplier=Element14; ComponentLink4Description: http://www.farnell.com/datasheets/2167052.pdf?src-supplier=Element14; ComponentLink5URL: http://www.farnell.com/datasheets/1868787.pdf?src-supplier=Element14; ComponentLink5Description: http://www.farnell.com/datasheets/1868787.pdf?src-supplier=Element14; ComponentLink6URL: http://www.yageo.com/documents/recent/PYu-RC_Group_51_RoHS_L_2.pdf?src-supplier=Avnet; ComponentLink6Description: http://www.yageo.com/documents/recent/PYu-RC_Group_51_RoHS_L_2.pdf?src-supplier=Avnet; ComponentLink7URL: https://www.verical.com/server-webapp/html/getDatasheet?partID=404327&src-supplier=Verical; ComponentLink7Description: https://www.verical.com/server-webapp/html/getDatasheet?partID=404327&src-supplier=Verical; ComponentLink8URL: http://www.farnell.com/datasheets/443971.pdf?src-supplier=Element14; ComponentLink8Description: http://www.farnell.com/datasheets/443971.pdf?src-supplier=Element14; Supplier Part Number 1: 311-1.00KHRDKR-ND; LCSC Part Number: C22548
R22 = RT0402CRE071K37L: RES SMD 1.37K OHM 1/16W 0402; Manufacturer: Yageo; Item Type: Resistors; Value: 1.37kR; Tolerance: 0.25%; Max Power Dissipation: 63mW; Temperature Coefficient: 50ppm/°C; Voltage Rating (DC): 50V; Supplier: Digikey; LCSC Part Number: C705664; Manufacturer Part Number: RT0402CRE071K37L; RoHS: Yes; Pricing: 1=0.1, 10=0.074, 50=0.0646, 100=0.0609, 500=0.05348, 1000=0.05071, 5000=0.04523 (USD); Case/Package: 0402; Case Code (Imperial): 0402; Min Operating Temperature: -55°C; Max Operating Temperature: 155°C; Package Quantity: 10000; Packaging: Tape and Reel; Number of Terminations: 2; Series: RT; Length: 0.039inch; Width: 0.02inch; Height: 0.014inch; Lead Free: Lead Free; RoHS Compliant: Yes; ComponentLink1URL: https://datasheet.ciiva.com/2586/pyu-rt-1-to-0-05-rohs-l-5-2586761.pdf?src-supplier=Digikey; ComponentLink1Description: https://datasheet.ciiva.com/2586/pyu-rt-1-to-0-05-rohs-l-5-2586761.pdf?src-supplier=Digikey
U2 = HUSB237-AA001-DN06R: DFN-6L-EP(2x2) USB PD ROHS; Manufacturer: Hynetek; Item Type: IC; Manufacturer Part Number: HUSB237-AA001-DN06R; Package: DFN-6L-EP(2x2); LCSC Part Number: C22373734; ComponentLink1Description: LCSC; ComponentLink1URL: https://www.lcsc.com/product-detail/USB-PD_Hynetek-HUSB237-AA001-DN06R_C22373734.html
U3 = AZ1117CH-3.3TRG1: 15V 1.3V @ 800mA Fixed 3.3V SOT-223 Linear Voltage Regulators (LDO) ROHS; Manufacturer: Diodes Incorporated; Item Type: IC; Manufacturer Part Number: AZ1117CH-3.3TRG1; Package: SOT-223; LCSC Part Number: C92102; ComponentLink1Description: LCSC; ComponentLink1URL: https://lcsc.com/product-detail/Linear-Voltage-Regulators-LDO_Diodes-Incorporated-AZ1117CH-3-3TRG1_C92102.html
U4 = LM25145RGYR: Buck Regulator Positive Output Step-Down DC-DC Controller IC 20-VQFN (3.5x4.5); Manufacturer: Texas Instruments; Supplier: Mouser; LCSC Part Number: C2876740; Manufacturer Part Number: LM25145RGYR; RoHS: Yes; Item Type: IC; Stock: 5164; Pricing: 1=1.94, 10=1.48, 50=1.35, 100=1.2, 1000=1.1, 10000=1 (USD); ComponentLink1URL: http://www.ti.com/lit/pdf/slyt741?src-supplier=Digikey; ComponentLink1Description: http://www.ti.com/lit/pdf/slyt741?src-supplier=Digikey